# Altium schematic sheet Power_LED.SchDoc: Power_Led
size A3
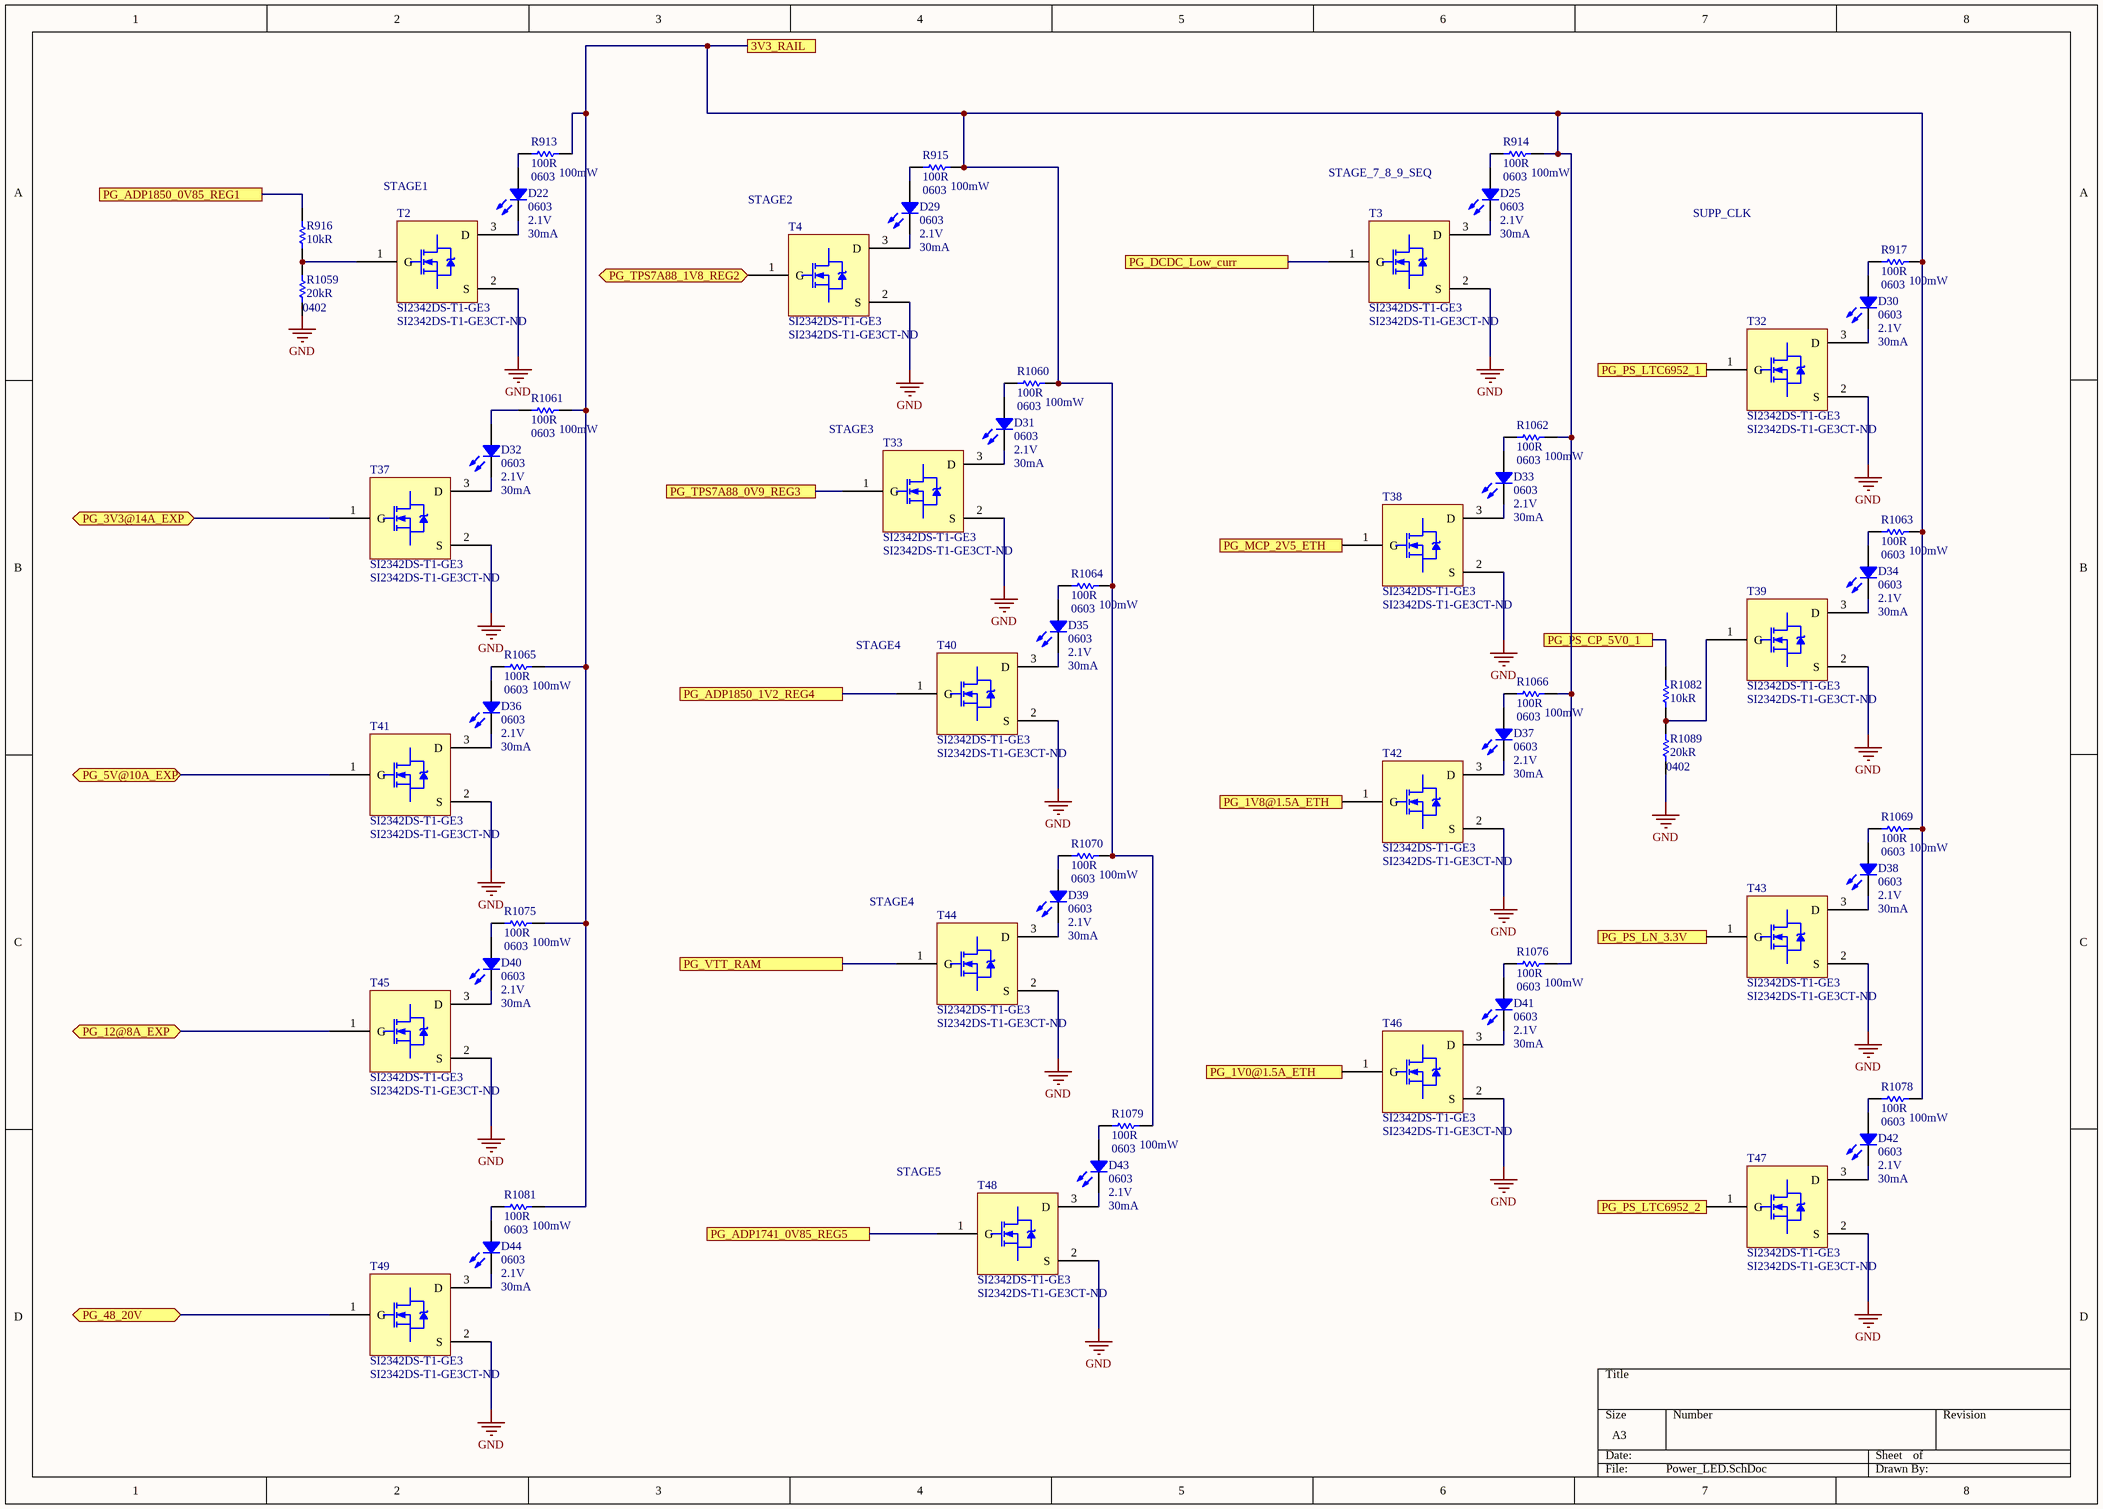
[diagram p0: Power_LED.SchDoc]

## Parts
D22  Case Code (Imperial): 0603  Forward Voltage: 2.1V  Forward Current: 30mA  [LED 0603/1608 GREEN]  (hidden comment: LTST-C190GKT)
D25  Case Code (Imperial): 0603  Forward Voltage: 2.1V  Forward Current: 30mA  [LED 0603/1608 GREEN]  (hidden comment: LTST-C190GKT)
D29  Case Code (Imperial): 0603  Forward Voltage: 2.1V  Forward Current: 30mA  [LED 0603/1608 GREEN]  (hidden comment: LTST-C190GKT)
D30  Case Code (Imperial): 0603  Forward Voltage: 2.1V  Forward Current: 30mA  [LED 0603/1608 GREEN]  (hidden comment: LTST-C190GKT)
D31  Case Code (Imperial): 0603  Forward Voltage: 2.1V  Forward Current: 30mA  [LED 0603/1608 GREEN]  (hidden comment: LTST-C190GKT)
D32  Case Code (Imperial): 0603  Forward Voltage: 2.1V  Forward Current: 30mA  [LED 0603/1608 GREEN]  (hidden comment: LTST-C190GKT)
D33  Case Code (Imperial): 0603  Forward Voltage: 2.1V  Forward Current: 30mA  [LED 0603/1608 GREEN]  (hidden comment: LTST-C190GKT)
D34  Case Code (Imperial): 0603  Forward Voltage: 2.1V  Forward Current: 30mA  [LED 0603/1608 GREEN]  (hidden comment: LTST-C190GKT)
D35  Case Code (Imperial): 0603  Forward Voltage: 2.1V  Forward Current: 30mA  [LED 0603/1608 GREEN]  (hidden comment: LTST-C190GKT)
D36  Case Code (Imperial): 0603  Forward Voltage: 2.1V  Forward Current: 30mA  [LED 0603/1608 GREEN]  (hidden comment: LTST-C190GKT)
D37  Case Code (Imperial): 0603  Forward Voltage: 2.1V  Forward Current: 30mA  [LED 0603/1608 GREEN]  (hidden comment: LTST-C190GKT)
D38  Case Code (Imperial): 0603  Forward Voltage: 2.1V  Forward Current: 30mA  [LED 0603/1608 GREEN]  (hidden comment: LTST-C190GKT)
D39  Case Code (Imperial): 0603  Forward Voltage: 2.1V  Forward Current: 30mA  [LED 0603/1608 GREEN]  (hidden comment: LTST-C190GKT)
D40  Case Code (Imperial): 0603  Forward Voltage: 2.1V  Forward Current: 30mA  [LED 0603/1608 GREEN]  (hidden comment: LTST-C190GKT)
D41  Case Code (Imperial): 0603  Forward Voltage: 2.1V  Forward Current: 30mA  [LED 0603/1608 GREEN]  (hidden comment: LTST-C190GKT)
D42  Case Code (Imperial): 0603  Forward Voltage: 2.1V  Forward Current: 30mA  [LED 0603/1608 GREEN]  (hidden comment: LTST-C190GKT)
D43  Case Code (Imperial): 0603  Forward Voltage: 2.1V  Forward Current: 30mA  [LED 0603/1608 GREEN]  (hidden comment: LTST-C190GKT)
D44  Case Code (Imperial): 0603  Forward Voltage: 2.1V  Forward Current: 30mA  [LED 0603/1608 GREEN]  (hidden comment: LTST-C190GKT)
R913  100R  Case/Package: 0603  Power Rating: 100mW  [RES 0603/1608 RF]
R914  100R  Case/Package: 0603  Power Rating: 100mW  [RES 0603/1608 RF]
R915  100R  Case/Package: 0603  Power Rating: 100mW  [RES 0603/1608 RF]
R916  10kR  [RES 0402/1005 RF KK]
R917  100R  Case/Package: 0603  Power Rating: 100mW  [RES 0603/1608 RF]
R1059  20kR  Case/Package: 0402  [RES 0402/1005 RF KK]
R1060  100R  Case/Package: 0603  Power Rating: 100mW  [RES 0603/1608 RF]
R1061  100R  Case/Package: 0603  Power Rating: 100mW  [RES 0603/1608 RF]
R1062  100R  Case/Package: 0603  Power Rating: 100mW  [RES 0603/1608 RF]
R1063  100R  Case/Package: 0603  Power Rating: 100mW  [RES 0603/1608 RF]
R1064  100R  Case/Package: 0603  Power Rating: 100mW  [RES 0603/1608 RF]
R1065  100R  Case/Package: 0603  Power Rating: 100mW  [RES 0603/1608 RF]
R1066  100R  Case/Package: 0603  Power Rating: 100mW  [RES 0603/1608 RF]
R1069  100R  Case/Package: 0603  Power Rating: 100mW  [RES 0603/1608 RF]
R1070  100R  Case/Package: 0603  Power Rating: 100mW  [RES 0603/1608 RF]
R1075  100R  Case/Package: 0603  Power Rating: 100mW  [RES 0603/1608 RF]
R1076  100R  Case/Package: 0603  Power Rating: 100mW  [RES 0603/1608 RF]
R1078  100R  Case/Package: 0603  Power Rating: 100mW  [RES 0603/1608 RF]
R1079  100R  Case/Package: 0603  Power Rating: 100mW  [RES 0603/1608 RF]
R1081  100R  Case/Package: 0603  Power Rating: 100mW  [RES 0603/1608 RF]
R1082  10kR  [RES 0402/1005 RF KK]
R1089  20kR  Case/Package: 0402  [RES 0402/1005 RF KK]
T2  SI2342DS-T1-GE3  Supplier Part Number 1: SI2342DS-T1-GE3CT-ND  [SI2342DS-T1-GE3]
T3  SI2342DS-T1-GE3  Supplier Part Number 1: SI2342DS-T1-GE3CT-ND  [SI2342DS-T1-GE3]
T4  SI2342DS-T1-GE3  Supplier Part Number 1: SI2342DS-T1-GE3CT-ND  [SI2342DS-T1-GE3]
T32  SI2342DS-T1-GE3  Supplier Part Number 1: SI2342DS-T1-GE3CT-ND  [SI2342DS-T1-GE3]
T33  SI2342DS-T1-GE3  Supplier Part Number 1: SI2342DS-T1-GE3CT-ND  [SI2342DS-T1-GE3]
T37  SI2342DS-T1-GE3  Supplier Part Number 1: SI2342DS-T1-GE3CT-ND  [SI2342DS-T1-GE3]
T38  SI2342DS-T1-GE3  Supplier Part Number 1: SI2342DS-T1-GE3CT-ND  [SI2342DS-T1-GE3]
T39  SI2342DS-T1-GE3  Supplier Part Number 1: SI2342DS-T1-GE3CT-ND  [SI2342DS-T1-GE3]
T40  SI2342DS-T1-GE3  Supplier Part Number 1: SI2342DS-T1-GE3CT-ND  [SI2342DS-T1-GE3]
T41  SI2342DS-T1-GE3  Supplier Part Number 1: SI2342DS-T1-GE3CT-ND  [SI2342DS-T1-GE3]
T42  SI2342DS-T1-GE3  Supplier Part Number 1: SI2342DS-T1-GE3CT-ND  [SI2342DS-T1-GE3]
T43  SI2342DS-T1-GE3  Supplier Part Number 1: SI2342DS-T1-GE3CT-ND  [SI2342DS-T1-GE3]
T44  SI2342DS-T1-GE3  Supplier Part Number 1: SI2342DS-T1-GE3CT-ND  [SI2342DS-T1-GE3]
T45  SI2342DS-T1-GE3  Supplier Part Number 1: SI2342DS-T1-GE3CT-ND  [SI2342DS-T1-GE3]
T46  SI2342DS-T1-GE3  Supplier Part Number 1: SI2342DS-T1-GE3CT-ND  [SI2342DS-T1-GE3]
T47  SI2342DS-T1-GE3  Supplier Part Number 1: SI2342DS-T1-GE3CT-ND  [SI2342DS-T1-GE3]
T48  SI2342DS-T1-GE3  Supplier Part Number 1: SI2342DS-T1-GE3CT-ND  [SI2342DS-T1-GE3]
T49  SI2342DS-T1-GE3  Supplier Part Number 1: SI2342DS-T1-GE3CT-ND  [SI2342DS-T1-GE3]

## Ports
3V3_RAIL, PG_1V0@1.5A_ETH, PG_1V8@1.5A_ETH, PG_3V3@14A_EXP (bidir), PG_5V@10A_EXP (bidir), PG_12@8A_EXP (bidir), PG_48_20V (bidir), PG_ADP1741_0V85_REG5, PG_ADP1850_0V85_REG1, PG_ADP1850_1V2_REG4, PG_DCDC_Low_curr, PG_MCP_2V5_ETH, PG_PS_CP_5V0_1, PG_PS_LN_3.3V, PG_PS_LTC6952_1, PG_PS_LTC6952_2, PG_TPS7A88_0V9_REG3, PG_TPS7A88_1V8_REG2 (bidir), PG_VTT_RAM

## Nets
GND: R1059.2 R1089.2 T2.2(S) T3.2(S) T4.2(S) T32.2(S) T33.2(S) T37.2(S) T38.2(S) T39.2(S) T40.2(S) T41.2(S) T42.2(S) T43.2(S) T44.2(S) T45.2(S) T46.2(S) T47.2(S) T48.2(S) T49.2(S)
3V3_RAIL: R913.2 R914.2 R915.2 R917.2 R1060.2 R1061.2 R1062.2 R1063.2 R1064.2 R1065.2 R1066.2 R1069.2 R1070.2 R1075.2 R1076.2 R1078.2 R1079.2 R1081.2 ; port 3V3_RAIL
PG_1V0@1.5A_ETH: T46.1(G) ; port PG_1V0@1.5A_ETH
PG_1V8@1.5A_ETH: T42.1(G) ; port PG_1V8@1.5A_ETH
PG_3V3@14A_EXP: T37.1(G) ; port PG_3V3@14A_EXP
PG_5V@10A_EXP: T41.1(G) ; port PG_5V@10A_EXP
PG_12@8A_EXP: T45.1(G) ; port PG_12@8A_EXP
PG_48_20V: T49.1(G) ; port PG_48_20V
PG_ADP1741_0V85_REG5: T48.1(G) ; port PG_ADP1741_0V85_REG5
PG_ADP1850_0V85_REG1: R916.1 ; port PG_ADP1850_0V85_REG1
PG_ADP1850_1V2_REG4: T40.1(G) ; port PG_ADP1850_1V2_REG4
PG_DCDC_Low_curr: T3.1(G) ; port PG_DCDC_Low_curr
PG_MCP_2V5_ETH: T38.1(G) ; port PG_MCP_2V5_ETH
PG_PS_CP_5V0_1: R1082.1 ; port PG_PS_CP_5V0_1
PG_PS_LN_3.3V: T43.1(G) ; port PG_PS_LN_3.3V
PG_PS_LTC6952_1: T32.1(G) ; port PG_PS_LTC6952_1
PG_PS_LTC6952_2: T47.1(G) ; port PG_PS_LTC6952_2
PG_TPS7A88_0V9_REG3: T33.1(G) ; port PG_TPS7A88_0V9_REG3
PG_TPS7A88_1V8_REG2: T4.1(G) ; port PG_TPS7A88_1V8_REG2
PG_VTT_RAM: T44.1(G) ; port PG_VTT_RAM
NetD22_1: D22.1 R913.1
NetD22_2: D22.2 T2.3(D)
NetD25_1: D25.1 R914.1
NetD25_2: D25.2 T3.3(D)
NetD29_1: D29.1 R915.1
NetD29_2: D29.2 T4.3(D)
NetD30_1: D30.1 R917.1
NetD30_2: D30.2 T32.3(D)
NetD31_1: D31.1 R1060.1
NetD31_2: D31.2 T33.3(D)
NetD32_1: D32.1 R1061.1
NetD32_2: D32.2 T37.3(D)
NetD33_1: D33.1 R1062.1
NetD33_2: D33.2 T38.3(D)
NetD34_1: D34.1 R1063.1
NetD34_2: D34.2 T39.3(D)
NetD35_1: D35.1 R1064.1
NetD35_2: D35.2 T40.3(D)
NetD36_1: D36.1 R1065.1
NetD36_2: D36.2 T41.3(D)
NetD37_1: D37.1 R1066.1
NetD37_2: D37.2 T42.3(D)
NetD38_1: D38.1 R1069.1
NetD38_2: D38.2 T43.3(D)
NetD39_1: D39.1 R1070.1
NetD39_2: D39.2 T44.3(D)
NetD40_1: D40.1 R1075.1
NetD40_2: D40.2 T45.3(D)
NetD41_1: D41.1 R1076.1
NetD41_2: D41.2 T46.3(D)
NetD42_1: D42.1 R1078.1
NetD42_2: D42.2 T47.3(D)
NetD43_1: D43.1 R1079.1
NetD43_2: D43.2 T48.3(D)
NetD44_1: D44.1 R1081.1
NetD44_2: D44.2 T49.3(D)
NetR916_2: R916.2 R1059.1 T2.1(G)
NetR1082_2: R1082.2 R1089.1 T39.1(G)

## Notes on the sheet
- STAGE_7_8_9_SEQ
- (near T2) STAGE1
- (near T4) STAGE2
- SUPP_CLK
- (near T33) STAGE3
- (near T40) STAGE4
- (near T44) STAGE4
- (near T48) STAGE5

## Library data of the parts
D22 D25 D29-D44 = LTST-C190GKT: LED,  LTST-C190GKT; Manufacturer 1: Vishay Lite-On; Color: Green; Lens Color: Colorless; Luminous Intensity: 6mcd; Viewing Angle: 130°; Lens Style: Clear,Diffused,Colorless,Rectangular; Power Rating: 100mW; Dominant Wavelength: 569nm; Test Current: 10mA; Lens Transparency: Clear; Number of Elements: 1; Wavelength: 565nm; Voltage: 2V; Reverse Voltage: 5V; Supplier 1: Digi-Key; Manufacturer Part Number 1: LTST-C190GKT; Stock 1: 908158; Pricing 1: 1=0.26000, 10=0.18800, 100=0.08880, 500=0.05922, 1000=0.04639 (USD); RoHS: Yes; Mount: Surface Mount; Case/Package: 0603; Number of Pins: 2; Case Code (Metric): 1608; Min Operating Temperature: -55°C; Max Operating Temperature: 85°C; Package Quantity: 1; Packaging: Tape and Reel; Illumination Color: Green; Power Dissipation: 100mW; Number of LEDs: 1; Length: 1.6mm; Height: 0.8mm; Width: 0.8mm; Depth: 0.8mm; Radiation Hardening: No; Lead Free: Lead Free; ComponentLink1URL: https://datasheet.ciiva.com/11775/0900766b80dc02a6-11775616.pdf?src-supplier=RSComponents; ComponentLink1Description: https://datasheet.ciiva.com/11775/0900766b80dc02a6-11775616.pdf?src-supplier=RSComponents; ComponentLink2URL: https://datasheet.ciiva.com/2109/ltst-c190gkt-2109985.pdf?src-supplier=Digi-Key; ComponentLink2Description: https://datasheet.ciiva.com/2109/ltst-c190gkt-2109985.pdf?src-supplier=Digi-Key; ComponentLink3URL: https://datasheet.ciiva.com/16392/lite-on20ltst-c190gkt-16392818.pdf?src-supplier=Future+Electronics; ComponentLink3Description: https://datasheet.ciiva.com/16392/lite-on20ltst-c190gkt-16392818.pdf?src-supplier=Future+Electronics; ComponentLink4URL: https://datasheet.ciiva.com/12403/lite-on-ltst-c190gkt-187204-12403884.pdf?src-supplier=Mouser; ComponentLink4Description: https://datasheet.ciiva.com/12403/lite-on-ltst-c190gkt-187204-12403884.pdf?src-supplier=Mouser; ComponentLink5URL: https://datasheet.ciiva.com/2109/ltst-c190gkt-2109986.pdf?src-supplier=Digi-Key; ComponentLink5Description: https://datasheet.ciiva.com/2109/ltst-c190gkt-2109986.pdf?src-supplier=Digi-Key; ComponentLink6URL: https://datasheet.ciiva.com/2109/ltst-c190gkt-2109987.pdf?src-supplier=Digi-Key; ComponentLink6Description: https://datasheet.ciiva.com/2109/ltst-c190gkt-2109987.pdf?src-supplier=Digi-Key; Supplier Part Number 1: 160-1183-1-ND
R913-R915 R917 R1060-R1066 R1069 R1070 R1075 R1076 R1078 R1079 R1081 = Resistor: KOA SPEAR ELECTRONICS - RK73H1JTTD1000F - RES, 100R, 1%, 0.1W, 0603, THICK FILM; Manufacturer: KOA Speer; Voltage Rating: 50V; Temperature Coefficient: 100ppm/°C; Supplier 1: Digi-Key; Supplier Part Number 1: 2019-RK73H1JTTD1000FCT-ND; Manufacturer Part Number: RK73H1JTTD1000F; RoHS: Yes; Category: Chip SMD Resistors; Stock 1: 1297624; Pricing 1: 1=0,10000, 10=0,02200, 100=0,00910, 1000=0,00408, 2500=0,00354 (USD); Number of Pins: 2; Case Code (Imperial): 0603; Case Code (Metric): 1608; Min Operating Temperature: -55°C; Max Operating Temperature: 155°C; Resistance: 100R; Tolerance: 1%; Packaging: Tape and Reel; Package Quantity: 5000; Composition: Thick Film; Termination: SMD/SMT; Military Standard: Not; Voltage Rating (DC): 50V; Length: 1.6mm; Height: 0.45mm; Width: 0.8mm; Depth: 0.8mm; REACH SVHC: Unknown; Lead Free: Lead Free; ComponentLink1URL: https://datasheet.ciiva.com/48426/rk73h-series-eng-jap-tds-48426518.pdf?src-supplier=Distrelec; ComponentLink1Description: https://datasheet.ciiva.com/48426/rk73h-series-eng-jap-tds-48426518.pdf?src-supplier=Distrelec; ComponentLink2URL: https://datasheet.ciiva.com/7773/549017-7773367.pdf?src-supplier=Element14; ComponentLink2Description: https://datasheet.ciiva.com/7773/549017-7773367.pdf?src-supplier=Element14; ComponentLink3URL: https://datasheet.ciiva.com/5556/rk73h-5556218.pdf?src-supplier=Mouser; ComponentLink3Description: https://datasheet.ciiva.com/5556/rk73h-5556218.pdf?src-supplier=Mouser
R916 R1082 = Resistor: Manufacturer 1: Yageo; Manufacturer Part Number 1: RC0402FR-0710KL; Tolerance: 1%; Temperature Coefficient: 100ppm/°C; Voltage Rating: 50V; Power Rating: 62.5mW; Supplier 1: Digi-Key; Supplier Part Number 1: 311-10.0KLRCT-ND; Stock 1: 71214322; Pricing 1: 1=0,10000, 10=0,01500, 100=0,00600, 1000=0,00270, 2500=0,00235, 5000=0,00194 (USD); RoHS: Yes; Case/Package: 0402; Number of Pins: 2; Case Code (Imperial): 0402; Case Code (Metric): 1005; Min Operating Temperature: -55°C; Max Operating Temperature: 155°C; Resistance: 10kR; Packaging: Tape and Reel; Composition: Thick Film; Voltage Rating (DC): 50V; Termination: SMD/SMT; Military Standard: Not; Working Voltage: 50V; Number of Terminations: 2; Length: 1mm; Height: 0.32mm; Width: 0.5mm; Depth: 0.5mm; Lead Pitch: 0.2mm; REACH SVHC: No SVHC; Lead Free: Lead Free; ComponentLink1URL: https://datasheet.ciiva.com/7660/38568-7660787.pdf?src-supplier=Element14; ComponentLink1Description: https://datasheet.ciiva.com/7660/38568-7660787.pdf?src-supplier=Element14; ComponentLink2URL: https://datasheet.ciiva.com/7849/1784430-7849813.pdf?src-supplier=Element14; ComponentLink2Description: https://datasheet.ciiva.com/7849/1784430-7849813.pdf?src-supplier=Element14; ComponentLink3URL: https://datasheet.ciiva.com/7849/1686128-7849814.pdf?src-supplier=Element14; ComponentLink3Description: https://datasheet.ciiva.com/7849/1686128-7849814.pdf?src-supplier=Element14; ComponentLink4URL: https://datasheet.ciiva.com/7849/1784430-7849815.pdf?src-supplier=Element14; ComponentLink4Description: https://datasheet.ciiva.com/7849/1784430-7849815.pdf?src-supplier=Element14; ComponentLink5URL: https://datasheet.ciiva.com/22747/1018594-22747512.pdf?src-supplier=Element14; ComponentLink5Description: https://datasheet.ciiva.com/22747/1018594-22747512.pdf?src-supplier=Element14; ComponentLink6URL: https://datasheet.ciiva.com/12667/pyu-rc0402-51-rohs-l-6-r-12667067.pdf?src-supplier=Mouser; ComponentLink6Description: https://datasheet.ciiva.com/12667/pyu-rc0402-51-rohs-l-6-r-12667067.pdf?src-supplier=Mouser; ComponentLink7URL: https://datasheet.ciiva.com/7983/1018594-7983486.pdf?src-supplier=Element14; ComponentLink7Description: https://datasheet.ciiva.com/7983/1018594-7983486.pdf?src-supplier=Element14
R1059 R1089 = Resistor: Manufacturer: Panasonic; Manufacturer Part Number: ERJ-2RKF2002X; Power Rating: 100mW; Tolerance: 1%; Voltage Rating: 50V; Temperature Coefficient: 100ppm/°C; Supplier 1: Digi-Key; Supplier Part Number 1: P20.0KLCT-ND; Stock 1: 2516725; Pricing 1: 1 = 0,10000, 10 = 0,05000, 100 = 0,02050, 1000 = 0,00920, 2500 = 0,00798, 5000 = 0,00660 (USD); RoHS: Yes; Mount: Surface Mount; Weight: 2.8E-05oz; Case Code (Metric): 1005; Case Code (Imperial): 0402; Contact Plating: Tin; Min Operating Temperature: -55°C; Max Operating Temperature: 155°C; Resistance: 20kR; Packaging: Cut Tape; Package Quantity: 1; Composition: Thick Film; Number of Terminations: 2; Termination: SMD/SMT; Military Standard: Not; Max Power Dissipation: 100mW; Voltage Rating (DC): 50V; Features: Automotive AEC-Q200; Length: 1mm; Height: 0.35mm; Width: 0.02inch; Depth: 0.5mm; Radiation Hardening: No; REACH SVHC: No SVHC; Lead Free: Lead Free; ComponentLink1URL: https://datasheet.ciiva.com/11821/0900766b80f80784-11821220.pdf?src-supplier=RSComponents; ComponentLink1Description: https://datasheet.ciiva.com/11821/0900766b80f80784-11821220.pdf?src-supplier=RSComponents; ComponentLink2URL: https://datasheet.ciiva.com/16762/70260748-16762885.pdf?src-supplier=Allied+Electronics; ComponentLink2Description: https://datasheet.ciiva.com/16762/70260748-16762885.pdf?src-supplier=Allied+Electronics; ComponentLink3URL: https://datasheet.ciiva.com/16782/70260748-16782455.pdf?src-supplier=Allied+Electronics; ComponentLink3Description: https://datasheet.ciiva.com/16782/70260748-16782455.pdf?src-supplier=Allied+Electronics; ComponentLink4URL: https://datasheet.ciiva.com/48531/aoa0000ce2-48531063.pdf?src-supplier=Avnet; ComponentLink4Description: https://datasheet.ciiva.com/48531/aoa0000ce2-48531063.pdf?src-supplier=Avnet; ComponentLink5URL: https://datasheet.ciiva.com/28688/1678782-28688600.pdf?src-supplier=Element14; ComponentLink5Description: https://datasheet.ciiva.com/28688/1678782-28688600.pdf?src-supplier=Element14; ComponentLink6URL: https://datasheet.ciiva.com/46377/426256-46377368.pdf?src-supplier=Element14; ComponentLink6Description: https://datasheet.ciiva.com/46377/426256-46377368.pdf?src-supplier=Element14; ComponentLink7URL: https://datasheet.ciiva.com/6138/426256-6138761.pdf?src-supplier=Farnell; ComponentLink7Description: https://datasheet.ciiva.com/6138/426256-6138761.pdf?src-supplier=Farnell; ComponentLink8URL: https://datasheet.ciiva.com/24159/aoa0000ce2-24159274.pdf?src-supplier=Mouser; ComponentLink8Description: https://datasheet.ciiva.com/24159/aoa0000ce2-24159274.pdf?src-supplier=Mouser; ComponentLink9URL: https://datasheet.ciiva.com/16508/aoa0000ce2-16508524.pdf?src-supplier=Future+Electronics; ComponentLink9Description: https://datasheet.ciiva.com/16508/aoa0000ce2-16508524.pdf?src-supplier=Future+Electronics; ComponentLink10URL: https://datasheet.ciiva.com/16514/aoa0000ce2-16514269.pdf?src-supplier=Avnet+Asia; ComponentLink10Description: https://datasheet.ciiva.com/16514/aoa0000ce2-16514269.pdf?src-supplier=Avnet+Asia; ComponentLink11URL: https://datasheet.ciiva.com/30049/aoa0000ce2-30049982.pdf?src-supplier=Onlinecomponents.com; ComponentLink11Description: https://datasheet.ciiva.com/30049/aoa0000ce2-30049982.pdf?src-supplier=Onlinecomponents.com
T2-T4 T32 T33 T37-T49 = SI2342DS-T1-GE3: Trans MOSFET N-CH 8V 6A 3-Pin SOT-23 T/R; Manufacturer: Vishay; Rds On Max: 17mR; Input Capacitance: 1.07nF; Rise Time: 14ns; Max Power Dissipation: 2.5W; Number of Elements: 1; Power Dissipation: 1.3W; Turn-On Delay Time: 6ns; Turn-Off Delay Time: 65ns; Fall Time: 25ns; Threshold Voltage: 800mV; Gate to Source Voltage (Vgs): 5V; Supplier 1: Digi-Key; Manufacturer Part Number: SI2342DS-T1-GE3; RoHS: Yes; Category: MOSFETs; Stock 1: 25972; Pricing 1: 1=0,50000, 10=0,42500, 25=0,39640, 100=0,29460, 250=0,27984, 500=0,23000, 1000=0,18695 (USD); Mount: Surface Mount; Case/Package: SOT-23; Number of Pins: 3; Contact Plating: Tin,Matte; Min Operating Temperature: -55°C; Max Operating Temperature: 150°C; Packaging: Tape and Reel; Package Quantity: 3000; Drain to Source Voltage (Vdss): 8V; Continuous Drain Current (ID): 6A; Radiation Hardening: No; REACH SVHC: No SVHC; Lead Free: Lead Free; ComponentLink1URL: https://datasheet.ciiva.com/14905/si2342ds-14905257.pdf?src-supplier=Arrow; ComponentLink1Description: https://datasheet.ciiva.com/14905/si2342ds-14905257.pdf?src-supplier=Arrow; ComponentLink2URL: https://datasheet.ciiva.com/29746/si2342ds-29746581.pdf?src-supplier=Digi-Key; ComponentLink2Description: https://datasheet.ciiva.com/29746/si2342ds-29746581.pdf?src-supplier=Digi-Key; ComponentLink3URL: https://datasheet.ciiva.com/30021/si2342ds-30021814.pdf?src-supplier=Avnet; ComponentLink3Description: https://datasheet.ciiva.com/30021/si2342ds-30021814.pdf?src-supplier=Avnet